# EasyEDA Pro project ProPrj_H750VBT6M2_2025-05-30.epro, board PCB2
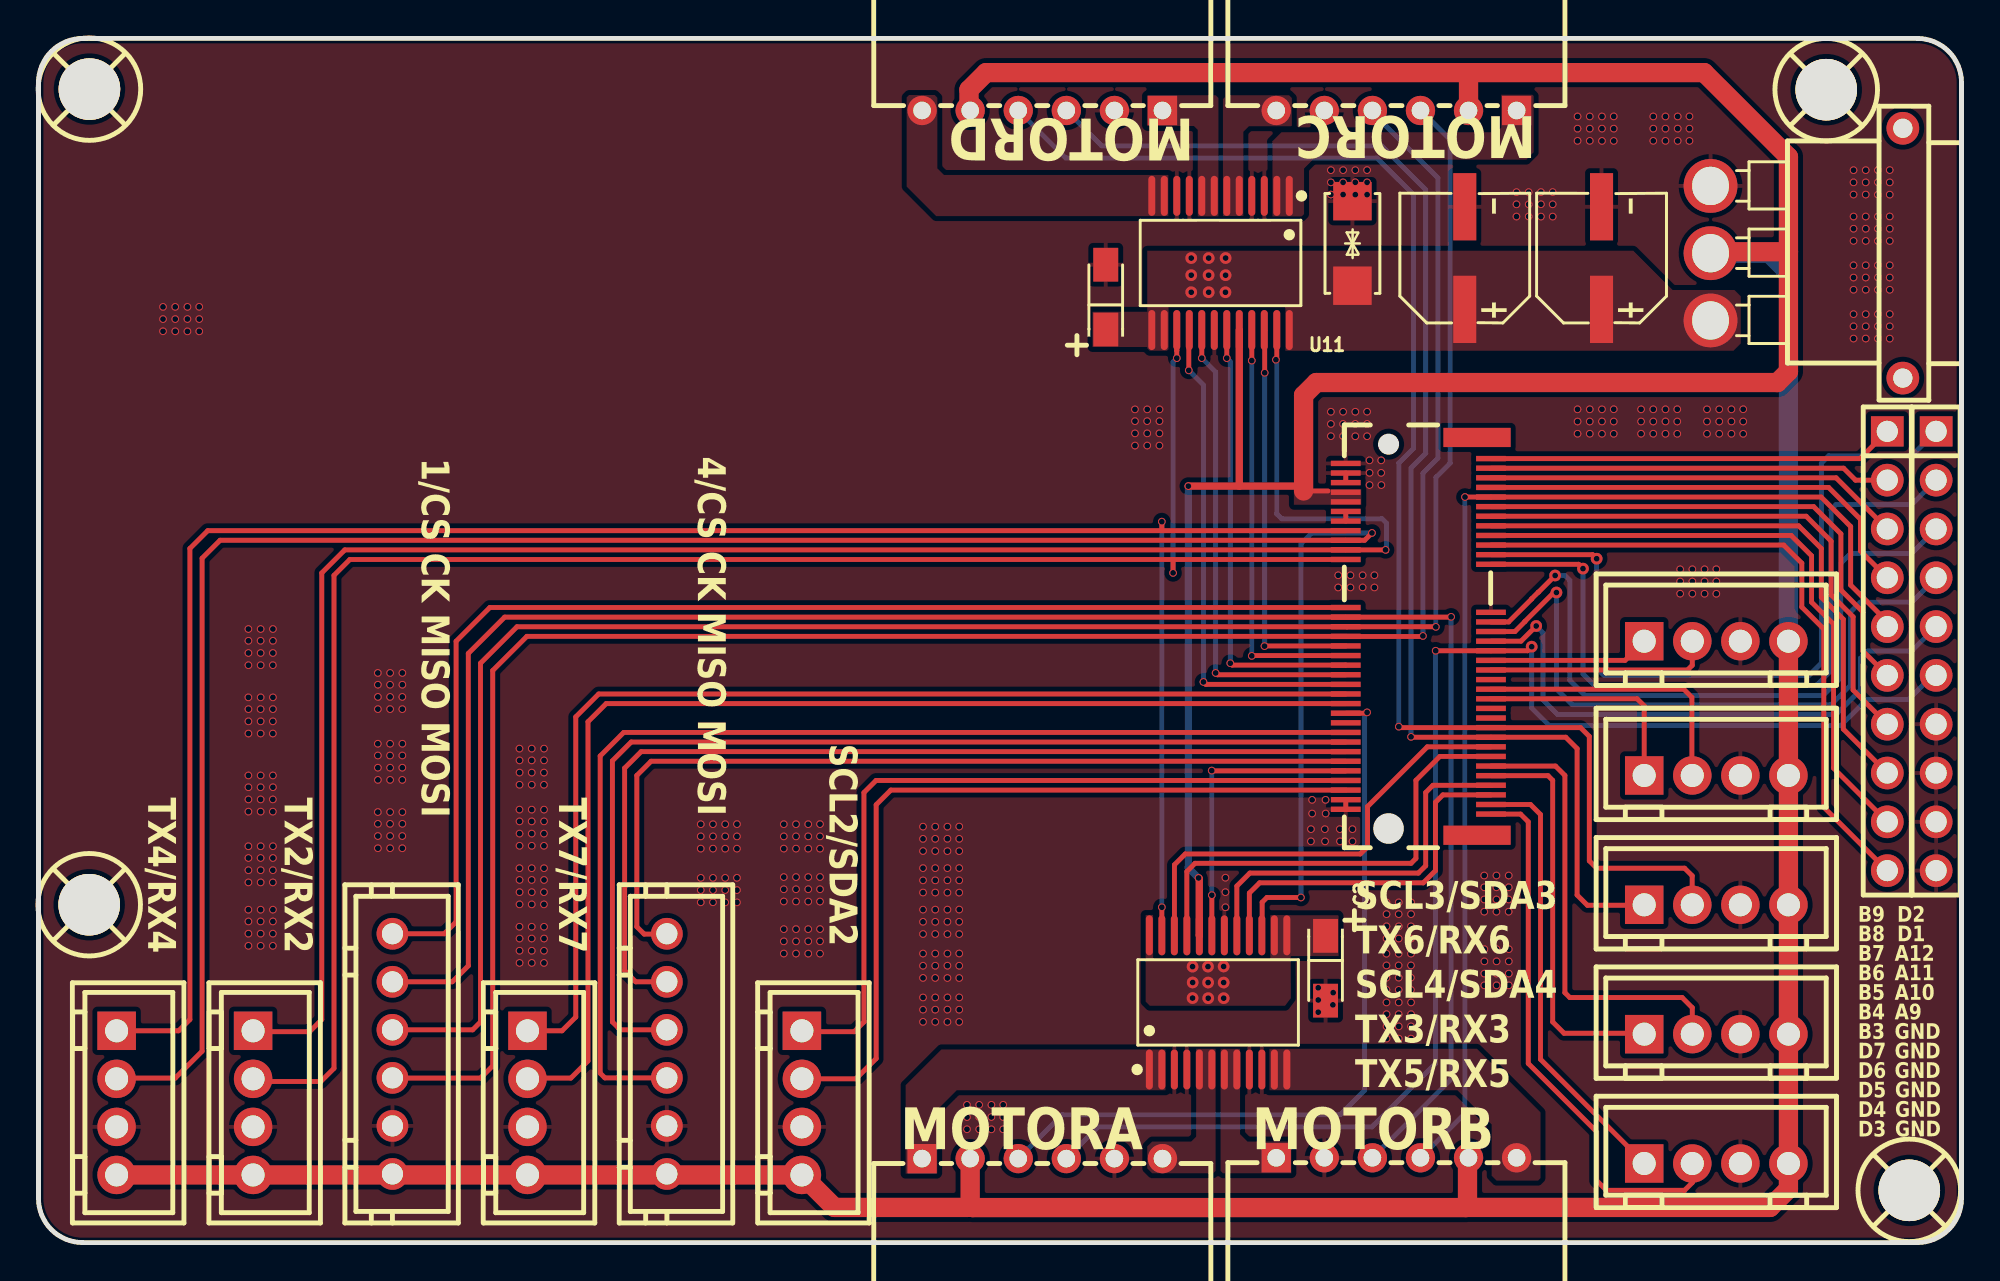
[diagram p4: board, top side]
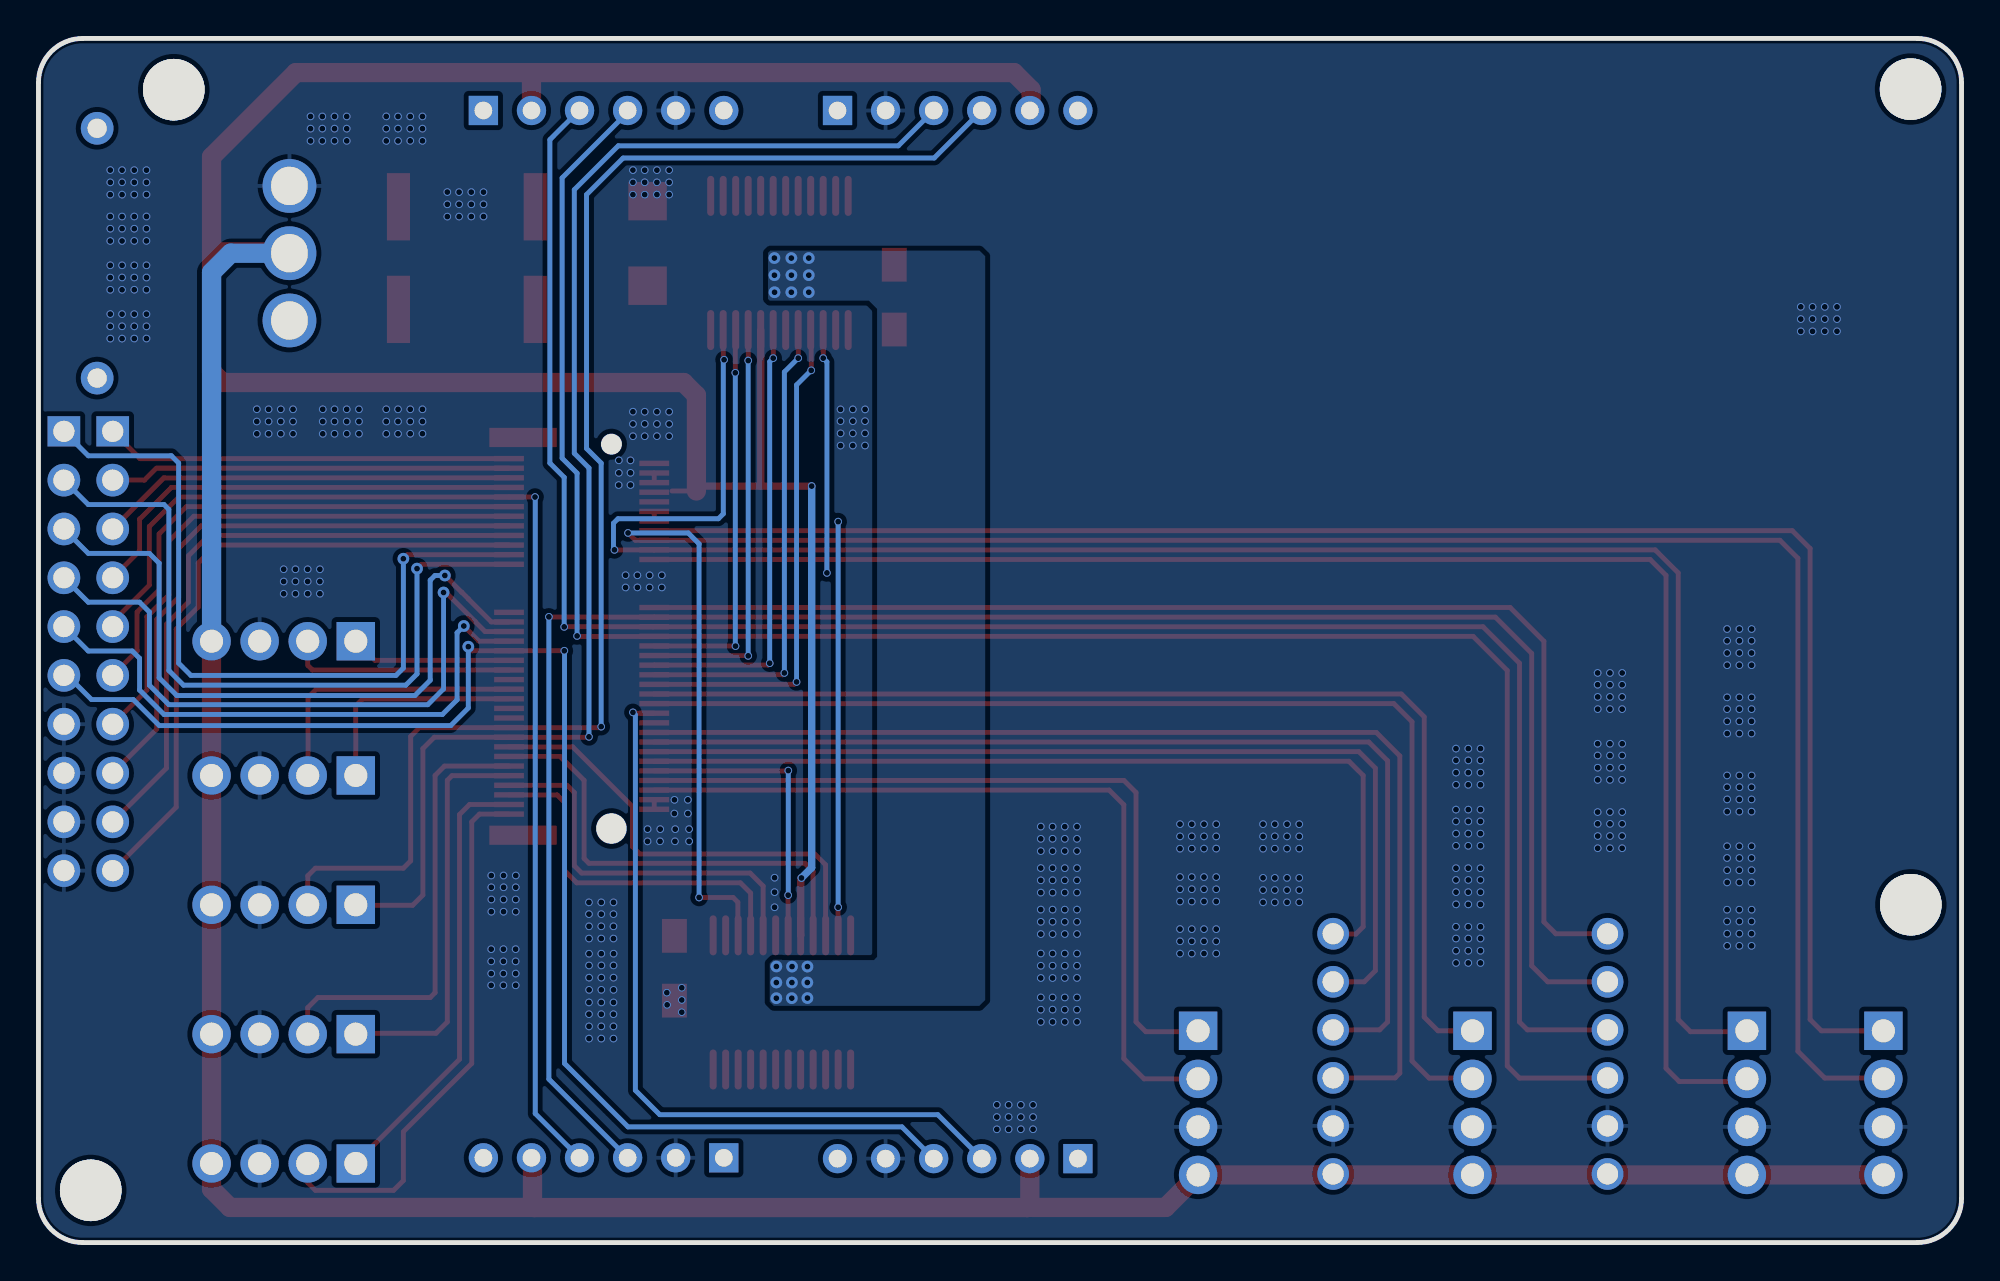
[diagram p5: board, bottom side, seen from below]

Outline 100 x 62.66 mm; copper layers: Top Layer, Bottom Layer. Coordinates in mm from the lower left corner of the outline.
Outline path: 0,60.36 0,2.3 arc(0.67,0.67) 2.3,0 97.7,0 arc(99.33,0.67) 100,2.3 100,60.36 arc(99.33,61.99) 97.7,62.66 2.3,62.66 arc(0.67,61.99) 0,60.36
Stack: Top Layer 0.035mm / Dielectric1 1.51mm FR4 er 4.5 / Bottom Layer 0.035mm

## Design rules (mm)
template: 自定义配置
spacing copperThickness1oz (default): track to track 0.152, other pairs 0.152 to 0.152
spacing copperThickness2oz: track to track 0.203, other pairs 0.152 to 0.3
track width copperThickness1oz (default): min 0.127, default 0.254, max 2.54
track width copperThickness2oz: min 0.203, default 0.254, max 2.54
differential pair differentialPair (default): width min 0.127, default 0.254, max 2.54; gap min 0.152, default 0.152
via viaSize (default): diameter min 0.399, default 0.399, max 10; hole min 0.3, default 0.305, max 6.299

## Placement (name value [footprint] x y rotation side)
C1  10uF  [CAP-SMD_L3.2-W1.6-RD-C7171]  55.5 49.2 90 top
C2  10uF  [CAP-SMD_L3.2-W1.6-RD-C7171]  66.93 14.28 270 top
C7  330uF  [CAP-SMD_BD6.3-L6.6-W6.6-FD]  81.28 51.23 90 top
C8  330uF  [CAP-SMD_BD6.3-L6.6-W6.6-FD]  74.17 51.23 90 top
CN18  WAFER-XH254Z-4A  [CONN-TH_XH-4A]  11.16 7.27 270 top
CN19  WAFER-XH254Z-6A  [CONN-TH_XH2.54-6P]  32.68 9.82 90 top
CN20  WAFER-XH254Z-6A  [CONN-TH_XH2.54-6P]  18.41 9.82 90 top
CN21  WAFER-XH254Z-4A  [CONN-TH_XH-4A]  87.25 10.85 0 top
CN22  WAFER-XH254Z-4A  [CONN-TH_XH-4A]  4.06 7.27 270 top
CN23  WAFER-XH254Z-4A  [CONN-TH_XH-4A]  87.25 4.12 0 top
CN24  WAFER-XH254Z-4A  [CONN-TH_XH-4A]  87.25 24.31 0 top
CN25  WAFER-XH254Z-4A  [CONN-TH_XH-4A]  25.43 7.27 270 top
CN26  WAFER-XH254Z-4A  [CONN-TH_XH-4A]  87.25 17.58 0 top
CN27  WAFER-XH254Z-4A  [CONN-TH_XH-4A]  87.25 31.29 0 top
CN28  WAFER-XH254Z-4A  [CONN-TH_XH-4A]  39.7 7.27 270 top
D1  SMAJ15CA  [SMA_L4.3-W2.6-LS5.0-BI]  68.33 51.99 90 top
H1  -  [HDR-TH_10P-P2.54-V-M-1]  98.68 30.78 270 top
H2  -  [HDR-TH_10P-P2.54-V-M-1]  96.14 30.78 270 top
SCREW1  -  [M3螺丝]  92.96 60 0 top
SCREW2  -  [M3螺丝]  2.65 60.02 0 top
SCREW3  -  [M3螺丝]  2.64 17.58 0 top
SCREW4  -  [M3螺丝]  97.28 2.72 0 top
U7  HYCW21E-05NGFF-320B  [CONN-SMD_HYCW21E-05NGFF-320B]  71.75 31.55 270 top
U8  MR30PW-M30.G.Y  [CONN-TH_MR30PW-M30-G-Y]  91.95 51.49 90 top
U10  TB6612FNG(O,C,8,EL  [SSOP-24_L8.4-W5.8-P0.65-LS7.8-BL]  61.34 12.5 0 top
U11  TB6612FNG(O,C,8,EL  [SSOP-24_L8.4-W5.8-P0.65-LS7.8-BL]  61.47 50.98 180 top
U12  WAFER-XH254WZ-6A  [CONN-TH_6P-P2.50_WAFER-XH254WZ-6A]  52.2 4.37 0 top
U13  WAFER-XH254WZ-6A  [CONN-TH_6P-P2.50_WAFER-XH254WZ-6A]  70.61 4.41 0 top
U14  WAFER-XH254WZ-6A  [CONN-TH_6P-P2.50_WAFER-XH254WZ-6A]  70.61 58.91 180 top
U15  WAFER-XH254WZ-6A  [CONN-TH_6P-P2.50_WAFER-XH254WZ-6A]  52.2 58.91 180 top

## Footprints (pads in the part's own frame, mm; a bottom-side part is the same pattern mirrored in y, then rotated)
CAP-SMD_BD6.3-L6.6-W6.6-FD
  rect 3.5x1.2 smd: 1(-2.67,0) 2(2.67,0)
CAP-SMD_L3.2-W1.6-RD-C7171
  rect 1.758x1.296 smd: 1(-1.687,0) 2(1.687,0)
CONN-SMD_HYCW21E-05NGFF-320B
  rect 0.28x1.55 smd: 1(-9.25,3.775) 2(-9,-3.775) 3(-8.75,3.775) 4(-8.5,-3.775) 5(-8.25,3.775) 6(-8,-3.775) 7(-7.75,3.775) 8(-7.5,-3.775) 9(-7.25,3.775) 10(-7,-3.775) 11(-6.75,3.775) 12(-6.5,-3.775) 13(-6.25,3.775) 14(-6,-3.775) 15(-5.75,3.775) 16(-5.5,-3.775) 17(-5.25,3.775) 18(-5,-3.775) 19(-4.75,3.775) 20(-4.5,-3.775) 21(-4.25,3.775) 22(-4,-3.775) 23(-3.75,3.775) 32(-1.5,-3.775) 33(-1.25,3.775) 34(-1,-3.775) 35(-0.75,3.775) 36(-0.5,-3.775) 37(-0.25,3.775) 38(0,-3.775) 39(0.25,3.775) 40(0.5,-3.775) 41(0.75,3.775) 42(1,-3.775) 43(1.25,3.775) 44(1.5,-3.775) 45(1.75,3.775) 46(2,-3.775) 47(2.25,3.775) 48(2.5,-3.775) 49(2.75,3.775) 50(3,-3.775) 51(3.25,3.775) 52(3.5,-3.775) 53(3.75,3.775) 54(4,-3.775) 55(4.25,3.775) 56(4.5,-3.775) 57(4.75,3.775) 58(5,-3.775) 59(5.25,3.775) 60(5.5,-3.775) 61(5.75,3.775) 62(6,-3.775) 63(6.25,3.775) 64(6.5,-3.775) 65(6.75,3.775) 66(7,-3.775) 67(7.25,3.775) 68(7.5,-3.775) 69(7.75,3.775) 70(8,-3.775) 71(8.25,3.775) 72(8.5,-3.775) 73(8.75,3.775) 74(9,-3.775) 75(9.25,3.775)
  rect 1x3.5 smd: 76(10.35,3.05) 77(-10.35,3.05)
CONN-TH_6P-P2.50_WAFER-XH254WZ-6A
  rect 1.524x1.524 hole 0.914: 1(-6.25,0)
  round 1.524 hole 0.914: 2(-3.75,0) 3(-1.25,0) 4(1.25,0) 5(3.75,0) 6(6.25,0)
CONN-TH_MR30PW-M30-G-Y
  round 2.8 hole 1.995x1.9: 1(-3.5,5) 2(0,5) 3(3.5,5)
  round 1.7 hole 1: 4(6.5,-5) 5(-6.5,-5)
CONN-TH_XH2.54-6P
  round 1.65 hole 1.1: 1(-6.25,0) 2(-3.75,0) 3(-1.25,0) 4(1.25,0) 5(3.75,0) 6(6.25,0)
CONN-TH_XH-4A
  rect 2x2 hole 1.2: 1(-3.75,0)
  round 2 hole 1.2: 2(-1.25,0) 3(1.25,0) 4(3.75,0)
HDR-TH_10P-P2.54-V-M-1
  rect 1.575x1.7 hole 1.1: 1(-11.43,0)
  round 1.7 hole 1.1: 2(-8.89,0) 3(-6.35,0) 4(-3.81,0) 5(-1.27,0) 6(1.27,0) 7(3.81,0) 8(6.35,0) 9(8.89,0) 10(11.43,0)
M3螺丝
  round 3.2 hole 3.2: 1(0,0)
SMA_L4.3-W2.6-LS5.0-BI
  rect 2x2 smd: 1(-2.2,0) 2(2.2,0)
SSOP-24_L8.4-W5.8-P0.65-LS7.8-BL
  oval 0.364x2.082 smd: 1(-3.575,-3.491) 2(-2.925,-3.491) 3(-2.275,-3.491) 4(-1.625,-3.491) 5(-0.975,-3.491) 6(-0.325,-3.491) 7(0.325,-3.491) 8(0.975,-3.491) 9(1.625,-3.491) 10(2.275,-3.491) 11(2.925,-3.491) 12(3.575,-3.491) 13(3.575,3.491) 14(2.925,3.491) 15(2.275,3.491) 16(1.625,3.491) 17(0.975,3.491) 18(0.325,3.491) 19(-0.325,3.491) 20(-0.975,3.491) 21(-1.625,3.491) 22(-2.275,3.491) 23(-2.925,3.491) 24(-3.575,3.491)

## Nets
As in the schematic.

Pads without a net: SCREW1 1; SCREW2 1; SCREW3 1; SCREW4 1; U7 76 77; U8 4 5

## Via types
v1: diameter 0.399, hole 0.305, Top Layer to Bottom Layer, 551 vias
v2: diameter 0.4, hole 0.305, Top Layer to Bottom Layer, 29 vias
v3: diameter 0.61, hole 0.305, Top Layer to Bottom Layer, 24 vias

## Routing (per net, layer and track width the routed paths; a pad name or vN(x,y) marks a point on that pad's centre or on a via; arc(x,y) is an arc through that point)
3V3: length 0.5
  Top Layer w0.254: U7.12 U7.14
5V: length 278.9
  Top Layer w0.254: 65.79,39.11 67.06,39.11
  Top Layer w0.381: v2(60.32,18.97) 60.36,18.94 60.36,15.99 60.37,15.99 ; 62.44,39.37 65.53,39.37 65.79,39.11 ; 62.44,39.37 62.44,47.49 ; 62.44,39.37 v2(59.79,39.37)
  Top Layer w1.001: 91,51.56 87.63,51.56 86.95,52.25 ; 91,51.56 91,45.33 90.42,44.75 66.45,44.75 65.79,44.09 65.79,39.11 ; 91,51.56 91,56.5 86.61,60.88 74.3,60.88 ; 74.31,1.9 74.23,1.82 48.58,1.82 48.45,1.95 ; 74.31,1.9 74.31,4.36 U13.5 ; 74.31,1.9 74.31,1.83 90.04,1.83 91,2.78 CN27.4 ; U15.5 48.39,58.97 48.39,60 49.28,60.88 74.3,60.88 ; CN22.4 CN18.4 CN25.4 CN28.4 41.39,1.83 48.33,1.83 48.45,1.95 ; U12.2 48.45,1.95 ; 74.3,60.88 74.36,60.82 U14.2
  Bottom Layer w0.381: v2(59.79,39.37) 59.79,19.51 v2(60.32,18.97)
  Bottom Layer w1.001: 86.95,52.25 87.71,51.49 90,51.49 91,50.48 CN27.4
12V:
  vias: v3(59.94,51.23) v3(59.94,50.34) v3(59.94,49.45) v3(60.01,14.36) v3(60.02,13.53) v3(60.01,12.72) v3(60.85,51.23) v3(60.85,50.34) v3(60.85,49.45) v3(60.81,14.36) v3(60.82,13.53) v3(60.83,12.72) v3(61.63,14.37) v3(61.63,13.53) v3(61.63,12.72) v3(61.73,51.23) v3(61.73,50.34) v3(61.72,49.45)
GND: length 1
  Top Layer w0.254: U7.4 U7.6 ; U7.72 U7.74
  vias: v1(6.48,48.69) v1(6.48,48.06) v1(6.48,47.42) v1(7.11,48.69) v1(7.11,48.06) v1(7.11,47.42) v1(7.75,48.69) v1(7.75,48.06) v1(7.75,47.42) v1(8.36,48.7) v1(8.36,48.06) v1(8.36,47.42) v1(10.92,31.93) v1(10.92,31.32) v1(10.92,30.68) v1(10.92,30.05) v1(10.92,28.37) v1(10.92,27.76) v1(10.92,27.12) v1(10.92,26.49) v1(10.92,24.31) v1(10.92,23.7) v1(10.92,23.06) v1(10.92,22.43) v1(10.92,20.62) v1(10.92,20.01) v1(10.92,19.38) v1(10.92,18.74) v1(10.92,17.32) v1(10.92,16.71) v1(10.92,16.08) v1(10.92,15.44) v1(11.55,31.93) v1(11.55,31.32) v1(11.55,30.68) v1(11.55,30.05) v1(11.55,28.37) v1(11.55,27.76) v1(11.55,27.12) v1(11.55,26.49) v1(11.55,24.31) v1(11.55,23.7) v1(11.55,23.06) v1(11.55,22.43) v1(11.55,20.62) v1(11.55,20.01) v1(11.55,19.38) v1(11.55,18.74) v1(11.55,17.32) v1(11.55,16.71) v1(11.55,16.08) v1(11.55,15.44) v1(12.19,31.93) v1(12.19,31.32) v1(12.19,30.68) v1(12.19,30.05) v1(12.19,28.37) v1(12.19,27.76) v1(12.19,27.12) v1(12.19,26.49) v1(12.19,24.31) v1(12.19,23.7) v1(12.19,23.06) v1(12.19,22.43) v1(12.19,20.62) v1(12.19,20.01) v1(12.19,19.38) v1(12.19,18.74) v1(12.19,17.32) v1(12.19,16.71) v1(12.19,16.08) v1(12.19,15.44) v1(17.65,29.64) v1(17.65,29.03) v1(17.65,28.39) v1(17.65,27.76) v1(17.65,25.96) v1(17.65,25.35) v1(17.65,24.71) v1(17.65,24.08) v1(17.65,22.4) v1(17.65,21.79) v1(17.65,21.16) v1(17.65,20.52) v1(18.28,29.64) v1(18.28,29.03) v1(18.28,28.39) v1(18.28,27.76) v1(18.28,25.96) v1(18.28,25.35) v1(18.28,24.71) v1(18.28,24.08) v1(18.28,22.4) v1(18.28,21.79) v1(18.28,21.16) v1(18.28,20.52) v1(18.92,29.64) v1(18.92,29.03) v1(18.92,28.39) v1(18.92,27.76) v1(18.92,25.96) v1(18.92,25.35) v1(18.92,24.71) v1(18.92,24.08) v1(18.92,22.4) v1(18.92,21.79) v1(18.92,21.16) v1(18.92,20.52) v1(25.01,25.7) v1(25.02,25.09) v1(25.02,24.46) v1(25.02,23.82) v1(25.01,22.53) v1(25.02,21.92) v1(25.02,21.28) v1(25.02,20.65) v1(25.01,19.48) v1(25.02,18.87) v1(25.02,18.23) v1(25.02,17.6) v1(25.01,16.43) v1(25.02,15.82) v1(25.02,15.19) v1(25.02,14.55) v1(25.65,25.7) v1(25.65,25.09) v1(25.65,24.46) v1(25.65,23.82) v1(25.65,22.53) v1(25.65,21.92) v1(25.65,21.28) v1(25.65,20.65) v1(25.65,19.48) v1(25.65,18.87) v1(25.65,18.23) v1(25.65,17.6) v1(25.65,16.43) v1(25.65,15.82) v1(25.65,15.19) v1(25.65,14.55) v1(26.29,25.7) v1(26.29,25.09) v1(26.29,24.46) v1(26.29,23.82) v1(26.29,22.53) v1(26.29,21.92) v1(26.29,21.28) v1(26.29,20.65) v1(26.29,19.48) v1(26.29,18.87) v1(26.29,18.23) v1(26.29,17.6) v1(26.29,16.43) v1(26.29,15.82) v1(26.29,15.19) v1(26.29,14.55) v1(34.44,21.77) v1(34.44,21.14) v1(34.44,20.5) v1(34.44,18.98) v1(34.44,18.34) v1(34.44,17.71) v1(35.07,21.77) v1(35.07,21.14) v1(35.07,20.5) v1(35.07,18.98) v1(35.07,18.34) v1(35.07,17.71) v1(35.71,21.77) v1(35.71,21.14) v1(35.71,20.5) v1(35.71,18.98) v1(35.71,18.35) v1(35.71,17.7) v1(36.32,21.77) v1(36.32,21.14) v1(36.32,20.5) v1(36.32,18.98) v1(36.32,18.34) v1(36.32,17.7) v1(38.76,21.77) v1(38.76,21.14) v1(38.76,20.5) v1(38.76,19.02) v1(38.76,18.39) v1(38.76,17.75) v1(38.76,16.31) v1(38.76,15.68) v1(38.76,15.04) v1(39.39,21.77) v1(39.39,21.14) v1(39.39,20.5) v1(39.39,19.02) v1(39.39,18.39) v1(39.39,17.75) v1(39.39,16.31) v1(39.39,15.68) v1(39.39,15.04) v1(40.03,21.77) v1(40.03,21.14) v1(40.03,20.5) v1(40.03,19.02) v1(40.03,18.39) v1(40.03,17.75) v1(40.03,16.31) v1(40.03,15.68) v1(40.03,15.04) v1(40.64,21.77) v1(40.64,21.14) v1(40.64,20.5) v1(40.64,19.02) v1(40.64,18.39) v1(40.64,17.75) v1(40.64,16.31) v1(40.64,15.68) v1(40.64,15.04) v1(46,21.64) v1(46,21.01) v1(46,20.37) v1(46,19.49) v1(46,18.85) v1(46,18.22) v1(46,17.33) v1(46,16.69) v1(46,16.06) v1(46,15.04) v1(46,14.41) v1(46,13.77) v1(46,12.75) v1(46,12.12) v1(46,11.48) v1(46.63,21.64) v1(46.63,21.01) v1(46.63,20.37) v1(46.63,19.49) v1(46.63,18.85) v1(46.63,18.22) v1(46.63,17.33) v1(46.63,16.69) v1(46.63,16.06) v1(46.63,15.04) v1(46.63,14.41) v1(46.63,13.77) v1(46.63,12.75) v1(46.63,12.12) v1(46.63,11.48) v1(47.27,21.64) v1(47.27,21.01) v1(47.27,20.37) v1(47.27,19.49) v1(47.27,18.85) v1(47.27,18.21) v1(47.27,17.33) v1(47.27,16.69) v1(47.27,16.05) v1(47.27,15.04) v1(47.27,14.41) v1(47.27,13.77) v1(47.27,12.75) v1(47.27,12.12) v1(47.27,11.48) v1(47.88,21.65) v1(47.88,21.01) v1(47.88,20.37) v1(47.88,19.49) v1(47.88,18.85) v1(47.88,18.21) v1(47.88,17.33) v1(47.88,16.69) v1(47.88,16.05) v1(47.88,15.04) v1(47.88,14.41) v1(47.88,13.77) v1(47.88,12.76) v1(47.88,12.12) v1(47.88,11.48) v1(48.28,7.17) v1(48.28,6.53) v1(48.28,5.9) v1(48.92,7.17) v1(48.92,6.53) v1(48.92,5.9) v1(49.55,7.17) v1(49.55,6.53) v1(49.55,5.89) v1(50.16,7.17) v1(50.16,6.53) v1(50.16,5.89) v1(57.02,43.36) v1(57.02,42.75) v1(57.02,42.11) v1(57.02,41.48) v1(57.65,42.75) v1(57.65,43.36) v1(57.65,42.11) v1(57.65,41.48) v1(58.29,43.36) v1(58.29,42.75) v1(58.29,42.11) v1(58.29,41.48) v1(61.72,18.99) v1(61.72,18.23) v1(61.72,17.45) v1(66.23,23.04) v1(66.23,22.33) v1(66.17,21.51) v1(66.17,20.88) v1(66.55,13.26) v1(66.55,12.62) v1(66.55,11.99) v1(66.93,23.04) v1(66.93,22.33) v1(66.89,21.51) v1(66.9,20.88) v1(67.21,55.81) v1(67.21,55.17) v1(67.21,54.54) v1(67.21,43.23) v1(67.21,42.6) v1(67.21,41.96) v1(67.32,13) v1(67.31,12.37) v1(67.59,34.73) v1(67.59,34.09) v1(67.67,21.51) v1(67.68,20.88) v1(67.84,55.81) v1(67.84,55.17) v1(67.84,54.54) v1(67.84,43.23) v1(67.84,42.6) v1(67.84,41.96) v1(68.22,34.73) v1(68.22,34.09) v1(68.33,21.51) v1(68.33,20.88) v1(68.48,55.81) v1(68.48,55.18) v1(68.48,54.53) v1(68.48,43.23) v1(68.48,42.6) v1(68.48,41.96) v1(68.86,34.73) v1(68.86,34.09) v1(69.09,55.81) v1(69.09,55.17) v1(69.09,54.53) v1(69.09,43.24) v1(69.09,42.6) v1(69.09,41.96) v1(69.22,40.71) v1(69.22,40.06) v1(69.22,39.42) v1(69.47,34.73) v1(69.47,34.09) v1(69.82,40.71) v1(69.82,40.05) v1(69.83,39.42) v1(70.1,17.7) v1(70.1,17.09) v1(70.1,16.46) v1(70.1,15.82) v1(70.09,15.03) v1(70.1,14.42) v1(70.1,13.79) v1(70.1,13.15) v1(70.1,12.5) v1(70.1,11.88) v1(70.1,11.25) v1(70.1,10.61) v1(70.74,17.7) v1(70.73,17.09) v1(70.74,16.46) v1(70.74,15.82) v1(70.73,15.03) v1(70.73,14.42) v1(70.73,13.79) v1(70.73,13.15) v1(70.74,12.5) v1(70.73,11.88) v1(70.74,11.25) v1(70.74,10.61) v1(71.37,17.7) v1(71.37,17.09) v1(71.37,16.46) v1(71.37,15.82) v1(71.37,15.03) v1(71.37,14.42) v1(71.37,13.79) v1(71.37,13.15) v1(71.37,12.5) v1(71.37,11.88) v1(71.37,11.25) v1(71.37,10.61) v1(75.18,19.1) v1(75.18,18.49) v1(75.18,17.85) v1(75.18,17.22) v1(75.19,15.27) v1(75.19,14.63) v1(75.18,14) v1(75.18,13.39) v1(75.82,19.1) v1(75.81,18.49) v1(75.82,17.85) v1(75.82,17.22) v1(75.82,15.27) v1(75.82,14.63) v1(75.83,14) v1(75.82,13.39) v1(76.45,17.85) v1(76.45,17.22) v1(76.45,19.1) v1(76.45,18.49) v1(76.46,15.27) v1(76.46,14.63) v1(76.46,14) v1(76.46,13.39) v1(76.86,54.66) v1(76.86,54.03) v1(76.86,53.39) v1(77.49,54.66) v1(77.49,54.03) v1(77.49,53.39) v1(78.13,54.66) v1(78.13,54.03) v1(78.13,53.39) v1(78.74,54.67) v1(78.74,54.03) v1(78.74,53.39) v1(80.03,58.6) v1(80.03,57.97) v1(80.03,57.33) v1(80.03,43.36) v1(80.03,42.73) v1(80.03,42.09) v1(80.67,58.6) v1(80.67,57.97) v1(80.67,57.33) v1(80.67,43.36) v1(80.67,42.73) v1(80.67,42.09) v1(81.3,58.6) v1(81.3,57.97) v1(81.3,57.33) v1(81.3,43.36) v1(81.3,42.73) v1(81.3,42.09) v1(81.91,58.6) v1(81.91,57.97) v1(81.91,57.33) v1(81.91,43.36) v1(81.91,42.73) v1(81.91,42.09) v1(83.33,43.36) v1(83.33,42.73) v1(83.33,42.09) v1(83.97,58.6) v1(83.97,57.97) v1(83.97,57.33) v1(83.97,43.36) v1(83.97,42.73) v1(83.97,42.09) v1(84.6,58.6) v1(84.6,57.97) v1(84.6,57.33) v1(84.6,43.36) v1(84.6,42.73) v1(84.6,42.09) v1(85.24,58.6) v1(85.24,57.97) v1(85.24,57.33) v1(85.22,43.36) v1(85.22,42.73) v1(85.22,42.09) v1(85.37,35.04) v1(85.37,34.4) v1(85.37,33.77) v1(85.85,58.6) v1(85.85,57.97) v1(85.85,57.33) v1(86,35.04) v1(86,34.4) v1(86,33.77) v1(86.64,35.04) v1(86.64,34.41) v1(86.64,33.76) v1(86.76,43.36) v1(86.76,42.73) v1(86.76,42.09) v1(87.25,35.04) v1(87.25,34.4) v1(87.25,33.76) v1(87.4,43.36) v1(87.4,42.73) v1(87.4,42.09) v1(88.03,43.36) v1(88.03,42.73) v1(88.03,42.09) v1(88.65,43.36) v1(88.65,42.73) v1(88.65,42.09) v1(94.38,55.81) v1(94.38,55.17) v1(94.38,54.54) v1(94.38,53.39) v1(94.38,52.76) v1(94.38,52.12) v1(94.38,50.85) v1(94.38,50.22) v1(94.38,49.58) v1(94.38,48.31) v1(94.38,47.68) v1(94.38,47.04) v1(95.02,55.81) v1(95.02,55.17) v1(95.02,54.54) v1(95.02,53.39) v1(95.02,52.76) v1(95.02,52.12) v1(95.02,50.85) v1(95.02,50.22) v1(95.02,49.58) v1(95.02,48.31) v1(95.02,47.68) v1(95.02,47.04) v1(95.65,55.81) v1(95.65,55.18) v1(95.65,54.53) v1(95.65,53.39) v1(95.65,52.76) v1(95.65,52.12) v1(95.65,50.85) v1(95.65,50.22) v1(95.65,49.58) v1(95.65,48.31) v1(95.65,47.68) v1(95.65,47.04) v1(96.27,55.81) v1(96.27,55.17) v1(96.27,54.53) v1(96.27,53.4) v1(96.27,52.76) v1(96.27,52.12) v1(96.27,50.86) v1(96.27,50.22) v1(96.27,49.58) v1(96.27,48.32) v1(96.27,47.68) v1(96.27,47.04)
12C3_SCL: length 8.4
  Top Layer w0.254: CN27.1 82.5,30.3 U7.43
12C3_SDA: length 11.8
  Top Layer w0.254: U7.45 85.75,29.8 86,30.04 CN27.2
AIN1: length 24
  Top Layer w0.254: 59.72,15.99 59.72,19.31 60.14,19.74 71.37,19.74 71.63,19.99 71.63,24.05 72.87,25.3 U7.63
AIN2: length 23.5
  Top Layer w0.254: 72.22,25.79 69.11,22.69 69.11,20.6 68.73,20.22 59.63,20.22 59.07,19.66 59.07,16.39 59.04,16.36 ; 72.21,25.8 U7.61
BIN1: length 20.2
  Top Layer w0.254: U7.69 72.51,23.8 72.14,23.42 72.14,19.61 71.75,19.23 62.99,19.23 62.32,18.55 62.32,15.99
BIN2: length 19
  Top Layer w0.254: 62.97,15.99 62.97,18.19 63.5,18.72 72.01,18.72 72.64,19.36 72.64,22.91 73.03,23.3 U7.71
CIN1: length 21.8
  Top Layer w0.254: U7.42 63.11,30.55 v2(63.09,30.53) ; U11.21 v2(63.09,45.9)
  Bottom Layer w0.254: v2(63.09,45.9) v2(63.09,30.53)
CIN2: length 20.7
  Top Layer w0.254: v1(63.76,45.26) 63.76,47.47 U11.22 ; U7.40 63.76,31.05 v2(63.75,31.04)
  Bottom Layer w0.254: v2(63.75,31.04) 63.76,31.05 v1(63.76,45.26)
DIN1: length 24.9
  Top Layer w0.254: U7.46 61.31,29.55 v2(61.21,29.64) ; U11.17 v2(60.49,46.03)
  Bottom Layer w0.254: v2(61.21,29.64) 61.21,45.3 v2(60.49,46.03)
DIN2: length 26.1
  Top Layer w0.254: U11.16 59.82,47.46 v2(59.82,45.39) ; U7.48 60.71,29.05 v2(60.58,29.17)
  Bottom Layer w0.254: v2(60.58,29.17) 60.58,44.63 v2(59.82,45.39)
ENCA_1: length 40.3
  Top Layer w0.254: U7.54 69.05,27.55 v2(69.09,27.59)
  Bottom Layer w0.254: v2(69.09,27.59) 68.96,27.46 68.96,7.93 67.69,6.66 53.23,6.66 U12.3
ENCA_2: length 73.5
  Top Layer w0.254: v3(77.65,31.01) 77.44,30.8 U7.41 v2(72.66,30.8) 72.64,30.78
  Bottom Layer w0.254: H1.6 98.5,29.52 97.24,28.26 95.07,28.26 93.71,26.9 78.56,26.9 77.65,27.82 v3(77.65,31.01) ; U12.4 55.1,6.02 69.34,6.02 72.64,9.32 72.64,30.78
ENCB_1: length 102.3
  Top Layer w0.254: v2(73.46,32.56) 73.44,32.55 U7.34 24.24,32.55 22.35,30.66 22.35,14.4 21.52,13.57 18.41,13.57
  Bottom Layer w0.254: v2(73.46,32.56) 73.46,8.51 U13.3
ENCB_2: length 62
  Top Layer w0.254: 74.17,38.79 v2(74.18,38.8) U7.9 92.7,38.8 94.23,37.26 94.23,34.21 96.14,32.31 H2.5
  Bottom Layer w0.254: U13.4 74.17,6.72 74.17,38.79
ENCC_1: length 101.7
  Top Layer w0.254: v2(72.66,32.04) 72.66,32.05 68.05,32.05 68.03,32.03 ; CN20.4 22.58,11.07 22.99,11.48 22.99,30.15 24.88,32.05 U7.36
  Bottom Layer w0.254: v2(72.66,32.04) 72.66,39.82 73.41,40.56 73.41,57.39 71.86,58.94
ENCC_2: length 104.2
  Top Layer w0.254: CN20.3 18.42,8.56 22.99,8.56 23.62,9.19 23.62,29.77 25.4,31.55 U7.38 ; v2(71.99,31.57) 71.96,31.54 67.99,31.54
  Bottom Layer w0.254: v2(71.99,31.57) 71.99,40.04 72.77,40.82 72.77,55.4 69.32,58.86
ENCD_1: length 69.5
  Top Layer w0.254: v2(71.37,26.32) 71.4,26.3 U7.59 79.42,26.3 80.01,25.7 80.01,18.09 80.54,17.55 83.22,17.55 83.5,17.83
  Bottom Layer w0.254: v2(71.37,26.32) 71.37,40.31 72.14,41.07 72.14,54.79 69.85,57.07 55.29,57.07 U15.3
ENCD_2: length 73.9
  Top Layer w0.254: v2(70.74,26.85) 70.79,26.8 U7.57 80.19,26.8 80.65,26.34 80.65,19.86 81.03,19.48 85.6,19.48 85.99,19.09 85.99,17.84 86,17.83
  Bottom Layer w0.254: v2(70.74,26.85) 70.74,40.56 71.5,41.33 71.5,54.53 69.6,56.44 53.42,56.44 U15.4
I2C2_SCL: length 40.7
  Top Layer w0.254: CN28.1 39.75,10.97 42.42,10.97 42.93,11.48 42.93,23.42 43.55,24.05 U7.68
I2C2_SDA: length 42.2
  Top Layer w0.254: U7.70 44.32,23.55 43.56,22.78 43.56,9.58 42.5,8.52 CN28.2
PA0: length 111.1
  Top Layer w0.254: v2(58.42,37.52) 58.42,37.06 58.43,37.05 ; 58.43,37.05 8.8,37.05 7.87,36.12 7.87,11.61 7.29,11.02 CN22.1 ; 58.43,37.05 U7.16 ; 58.42,15.99 v2(58.42,17.45)
  Bottom Layer w0.254: v2(58.42,17.45) v2(58.42,37.52)
PA1: length 118.3
  Top Layer w0.254: CN22.2 4.1,8.56 7.11,8.56 8.51,9.96 8.51,35.61 9.45,36.55 U7.18 68.96,36.55 v2(69.34,36.93) ; 63.62,15.99 63.63,16 63.63,17.71 63.88,17.96 v2(65.65,17.96)
  Bottom Layer w0.254: v2(65.65,17.96) 65.65,36.36 66.21,36.93 v2(69.34,36.93)
PA2: length 99.8
  Top Layer w0.254: CN18.1 11.21,10.97 14.1,10.97 14.73,11.61 14.73,34.85 15.93,36.05 U7.20 v2(70.05,36.05) 70.1,35.99 ; U11.23 64.39,45.99 v2(64.35,45.94)
  Bottom Layer w0.254: 70.09,36.13 70.1,36.14 70.1,37.43 69.87,37.67 64.64,37.67 64.39,37.92 64.39,45.9 v2(64.35,45.94)
PA3: length 96.6
  Top Layer w0.254: 59,35.55 16.19,35.55 15.37,34.72 15.37,9.07 14.68,8.38 11.3,8.38 CN18.2 ; 59,35.55 U7.22 ; 59,35.55 v2(59,34.85) ; v2(59.19,46.03) 59.19,46.42 59.19,46.43 59.19,46.78 59.19,46.78 U11.15
  Bottom Layer w0.254: v2(59.19,46.03) 59,45.83 v2(59,34.85)
PA4: length 65.2
  Top Layer w0.254: U7.32 23.47,33.05 21.72,31.29 21.72,16.69 21.1,16.07 18.41,16.07
PA10: length 30.3
  Top Layer w0.254: v3(77.88,32.09) 77.09,31.3 U7.39
  Bottom Layer w0.254: H1.5 97.41,30.78 95.12,30.78 94.74,30.4 94.74,28.75 93.47,27.48 78.99,27.48 78.23,28.25 78.23,31.74 v3(77.88,32.09)
PA11: length 34.3
  Top Layer w0.254: v3(78.94,33.83) 78.8,33.83 77.3,32.33 77.3,32.32 76.78,31.8 U7.37
  Bottom Layer w0.254: H1.4 97.41,33.33 94.74,33.33 94.23,32.82 94.23,29.01 93.22,27.99 79.76,27.99 78.94,28.81 v3(78.94,33.83)
PA12: length 36.9
  Top Layer w0.254: U7.35 76.45,32.3 77.65,33.49 77.65,33.5 77.99,33.84 78,33.84 v3(78.87,34.71)
  Bottom Layer w0.254: H1.3 97.41,35.87 94.23,35.87 93.73,35.36 93.73,29.39 92.81,28.47 80.42,28.47 79.63,29.26 79.63,34.47 79.38,34.71 v3(78.87,34.71)
PB0: length 23.5
  Top Layer w0.254: v2(61.98,30.15) 62.07,30.05 67.98,30.05 U7.44 ; U11.19 v2(61.79,46.03)
  Bottom Layer w0.254: v2(61.98,30.15) 61.98,45.84 v2(61.79,46.03)
PB4: length 23.5
  Top Layer w0.254: H2.4 94.74,35.99 94.74,37.64 93.09,39.3 U7.7
PB5: length 21.7
  Top Layer w0.254: U7.5 93.48,39.8 H2.3
PB8: length 21.5
  Top Layer w0.254: 96.14,39.04 H2.2 94.49,39.67 93.87,40.3 U7.3
PB9: length 21.2
  Top Layer w0.254: H2.1 94.72,40.8 U7.1
PB12: length 28.8
  Top Layer w0.254: 86,4.37 86,3.12 85.6,2.72 81.53,2.72 81.03,3.23 81.03,5.77 77.47,9.32 77.47,21.89 77.07,22.3 U7.75
PB13: length 23.1
  Top Layer w0.254: U7.73 77.58,22.8 78.1,22.28 78.1,9.54 83.27,4.37 83.5,4.37
PC6: length 11.5
  Top Layer w0.254: U7.51 83.13,28.3 83.5,27.93 83.5,24.56
PC7: length 14.4
  Top Layer w0.254: U7.49 85.55,28.8 85.98,28.37 85.98,24.58 86,24.56
PD1: length 38.3
  Top Layer w0.254: U7.23 80.09,35.3 v3(80.31,35.07)
  Bottom Layer w0.254: H1.2 97.41,38.41 93.47,38.41 93.22,38.15 93.22,29.77 92.46,29.01 80.9,29.01 80.31,29.59 v3(80.31,35.07)
PD2: length 40.4
  Top Layer w0.254: v3(81.03,35.59) 80.81,35.8 U7.21
  Bottom Layer w0.254: v3(81.03,35.59) 81.03,29.9 81.41,29.52 92.07,29.52 92.71,30.15 92.71,40.56 93.09,40.95 97.41,40.95 H1.1
PD3: length 34.4
  Top Layer w0.254: H2.10 92.84,22.66 92.84,31.93 91.69,33.07 91.69,35.36 90.75,36.3 U7.19
PD4: length 32.6
  Top Layer w0.254: H2.9 93.34,24.69 93.34,32.18 92.2,33.33 92.2,35.74 91.14,36.8 U7.17
PD5: length 31.2
  Top Layer w0.254: 96.14,24.05 H2.8 93.85,26.72 93.85,32.44 92.71,33.58 92.71,36.12 91.53,37.3 U7.15
PD6: length 29
  Top Layer w0.254: H2.7 94.36,28.75 94.36,32.56 93.22,33.71 93.22,36.5 91.92,37.8 U7.13
PD7: length 27.3
  Top Layer w0.254: 96.14,29.39 H2.6 94.87,30.78 94.87,32.82 93.73,33.96 93.73,36.88 92.31,38.3 U7.11
PD8: length 21
  Top Layer w0.254: 83.5,11.1 83.29,10.89 79.33,10.89 78.74,11.48 78.74,24.05 78.5,24.3 U7.67
PD9: length 23.4
  Top Layer w0.254: U7.65 78.89,24.8 79.38,24.31 79.38,13 79.63,12.75 85.47,12.75 86,12.22 86,11.1
PE7: length 59
  Top Layer w0.254: CN25.1 27.23,11.02 27.94,11.74 27.94,27.36 29.13,28.55 U7.50
PE8: length 61
  Top Layer w0.254: U7.52 29.52,28.05 28.58,27.1 28.58,9.45 27.69,8.56 25.47,8.56 CN25.2
PE11: length 59.4
  Top Layer w0.254: U7.58 30.43,26.55 29.21,25.32 29.21,8.81 29.45,8.57 CN19.3
PE12: length 55.1
  Top Layer w0.254: U7.60 30.82,26.05 29.84,25.07 29.84,11.48 30.26,11.07 CN19.4
PE13: length 50.8
  Top Layer w0.254: 32.68,13.57 31.06,13.57 30.48,14.15 30.48,24.69 31.34,25.55 U7.62
PE14: length 46.8
  Top Layer w0.254: 32.68,16.07 32.66,16.05 31.5,16.05 31.12,16.43 31.12,24.31 31.85,25.05 U7.64
PE15: length 15.6
  Top Layer w0.254: 61.01,18.09 v2(61.02,18.08) 61.02,15.99 ; v2(61.01,24.56) 61.03,24.55 U7.66
  Bottom Layer w0.254: 61.01,18.09 v2(61.01,24.56)

## Copper pours and planes (outline as drawn; the poured copper is in the pictures)
5V on Top Layer: 65.28,39.2 68.79,39.2 68.79,38.39 65.28,38.39
12V on Top Layer: 54.81,48.44 58.77,48.44 58.77,46.6 54.81,46.6
12V on Top Layer: 64.07,17.03 67.61,17.03 67.61,14.91 64.07,14.91
12V on Top Layer: 57.66,51.61 88.52,51.61 88.52,46.41 57.66,46.41
12V on Top Layer: 57.57,17.05 65.13,17.05 65.13,12.32 57.57,12.32
12V on Bottom Layer: 50.77,51.62 62.06,51.62 62.06,12.32 50.77,12.32
GND on Top Layer: -2.33,65.09 101.96,65.09 101.96,-4.36 -2.33,-4.36
GND on Bottom Layer: -5.72,66.73 105.66,66.73 105.66,-4.52 -5.72,-4.52
$1N1888 on Top Layer: 45.09,10.05 58.6,10.05 58.6,3.58 45.09,3.58
$1N1903 on Top Layer: 57.66,10.08 61.21,10.08 61.21,3.61 57.66,3.61
$1N1916 on Top Layer: 64.01,10.08 78.1,10.08 78.1,3.23 64.01,3.23
$1N1922 on Top Layer: 61.47,10.08 65.15,10.08 65.15,3.61 61.47,3.61
$1N2388 on Top Layer: 45.15,59.72 58.75,59.72 58.75,53.42 45.15,53.42
$1N2391 on Top Layer: 61.59,59.7 65.18,59.7 65.18,53.42 61.59,53.42
$1N2394 on Top Layer: 57.64,59.7 61.36,59.7 61.36,53.4 57.64,53.4
$1N2421 on Top Layer: 64.14,59.73 77.75,59.73 77.75,53.4 64.14,53.4

## Text on the board
Top Silkscreen Layer: B9 | B8 | B7 | B6 | B5 | B4 | B3 | D7 | D6 | D5 | D4 | D3 | A12 | A11 | A10 | A9 | GND | D2 | D1 | TX4/RX4 | TX2/RX2 | 1/CS CK MISO MOSI | TX7/RX7 | 4/CS CK MISO MOSI | SCL2/SDA2 | SCL4/SDA4 | SCL3/SDA3 | TX6/RX6 | TX3/RX3 | TX5/RX5 | MOTORA | MOTORB | MOTORD | MOTORC
